# EasyEDA Pro project eda_uahyxtbgs-165w-three-way-multi-protocol-fa-dc91a91e.epro, schematic 165W指示灯版三路桌面电源
Board Name: 165W 三路多协议快充电源; Create Date: 2025-04-07; Page Name: P1; Project Name: （高颜值）220V供电165W三路多协议桌面快充电源; Schematic Name: 165W 三路多协议快充电源; Update Date: 2025-04-09; Company: 嘉立创EDA; Page Size: A4; Version: V1.0
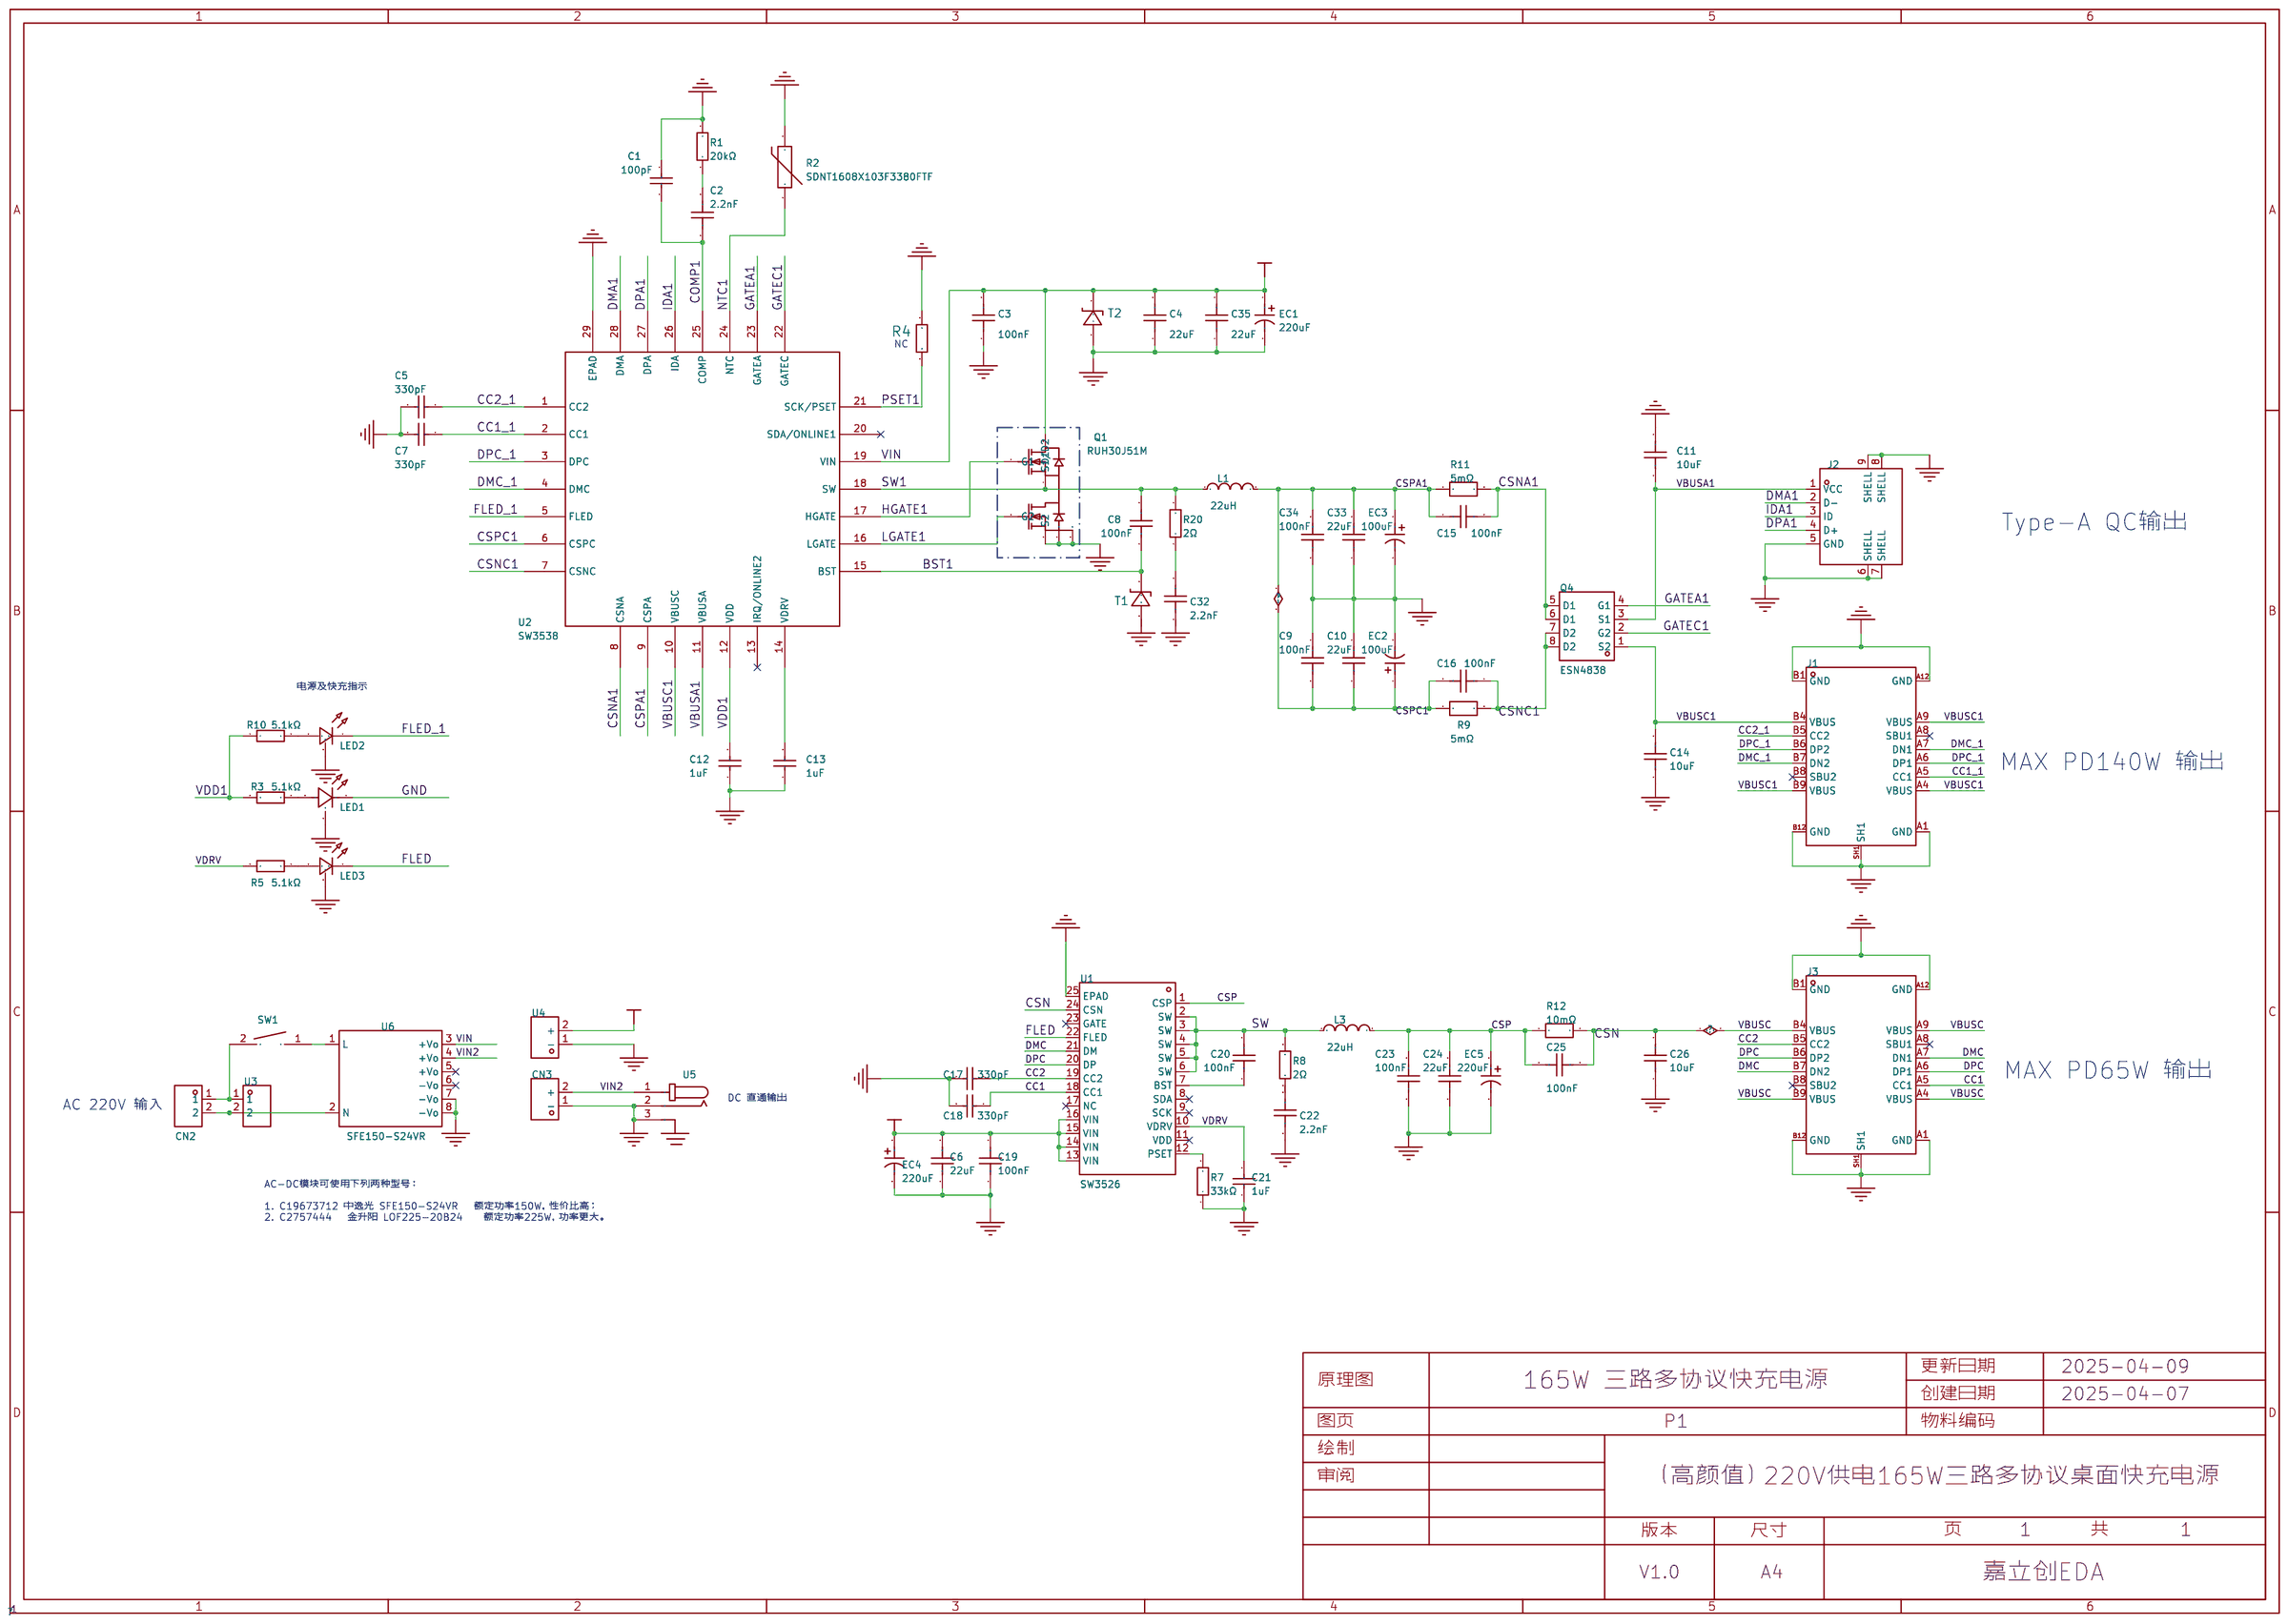
[diagram p0: schematic sheet]

## Parts
C1  100pF  [C0603]
C2  2.2nF  [C0603_1]
C3  100nF  [C0603_1]
C4  22uF  [C0805]
C5  330pF  [C0603]
C6  22uF  [C0805]
C7  330pF  [C0603]
C8  100nF  [C0603_1]
C9  100nF  [C0603_1]
C10  22uF  [C0805]
C11  10uF  [C0805]
C12  1uF  [C0603]
C13  1uF  [C0603]
C14  10uF  [C0805]
C15  100nF  [C0603_1]
C16  100nF  [C0603_1]
C17  330pF  [C0603]
C18  330pF  [C0603]
C19  100nF  [C0603_1]
C20  100nF  [C0603_1]
C21  1uF  [C0603]
C22  2.2nF  [C0603_1]
C23  100nF  [C0603_1]
C24  22uF  [C0805]
C25  100nF  [C0603_1]
C26  10uF  [C0805]
C32  2.2nF  [C0603_1]
C33  22uF  [C0805]
C34  100nF  [C0603_1]
C35  22uF  [C0805]
CN2  RT-C08-F2-BH  [AC-IN-TH_RT-C08-F2-WH]
CN3  XT30UPB-M  [CONN-TH_XT30UPB-M]
EC1  220uF  [CAP-TH_BD8.0-P3.50-D0.6-FD-2]
EC2  100uF  [CAP-TH_BD8.0-P3.50-D0.6-FD]
EC3  100uF  [CAP-TH_BD8.0-P3.50-D0.6-FD]
EC4  220uF  [CAP-TH_BD8.0-P3.50-D0.6-FD-2]
EC5  220uF  [CAP-TH_BD8.0-P3.50-D0.6-FD-2]
J1  U263-163N-4OS1735  [USB-C-SMD_U263-163N-4GS1735]
J2  U224-051N-3GRA035  [USB-A-TH_U224-051N-3GRA035]
J3  U263-163N-4OS1735  [USB-C-SMD_U263-163N-4GS1735]
L1  22uH  [IND-TH_L20-W10-P9.00-D1.2]
L3  22uH  [IND-TH_L20-W10-P9.00-D1.2]
LED1  XL-3210UGC  [LED-SMD_3P-L3.2-W1.5-RD_GREEN]
LED2  XL-3210UOC  [LED-SMD_3P-L3.2-W1.5-RD_ORANGE]
LED3  XL-3210UOC  [LED-SMD_3P-L3.2-W1.5-RD_ORANGE]
Q1  RUH30J51M  [DFN-8_L6.0-W5.0-P1.27_AON6938]
Q4  ESN4838  [DFN-8_L3.0-W3.0-P0.65-LS3.4-BL]
R1  20kΩ  [R0603]
R2  SDNT1608X103F3380FTF  [R0603_1]
R3  5.1kΩ  [R0603_1]
R4  100kΩ  [R0603_1]
R5  5.1kΩ  [R0603_1]
R7  33kΩ  [R0603]
R8  2Ω  [R0603_1]
R9  5mΩ  [R1206]
R10  5.1kΩ  [R0603_1]
R11  5mΩ  [R1206]
R12  10mΩ  [R1206]
R20  2Ω  [R0603_1]
SW1  RS601HL-1010011BB  [SW-TH_RS601HL-1010011BB]
T1  SMF30A  [SOD-123_L2.6-W1.6-LS3.5-RD]
T2  SMF30A  [SOD-123_L2.6-W1.6-LS3.5-RD]
U1  SW3526  [QFN-24_L4.0-W4.0-P0.50-TL-EP2.5]
U2  SW3538  [QFN-28_L4.0-W4.0-P0.40-TL-EP2.4]
U3  DBT50G-7.62-2P-BK-P  [CONN-TH_2P-P7.62_L15.2-W16.7-EX4.2]
U4  XT30UPB-M  [CONN-TH_XT30UPB-M]
U5  HX DC007B-2.0-J  [DC-IN-TH_HX-DC007B-2.5]
U6  SFE150-S24VR  [LOF225-20B24]

## Library data of the parts
C1 = CL10C101JB8NNNC: 容值:100pF;精度:±5%;额定电压:50V;材质(温度系数):C0G;; LCSC Part Name: 100pF ±5% 50V; Supplier Part: C14858; Manufacturer: SAMSUNG(三星); Supplier Footprint: 0603; JLCPCB Part Class: 基础库; Datasheet: https://atta.szlcsc.com/upload/public/pdf/source/20160103/1457707672333.pdf; Supplier: LCSC; Tolerance: ±5%; Voltage Rated: 50V; Temperature Coefficient: C0G
C2 = FCC0603B222K500CT: 容值:2.2nF;精度:±10%;额定电压:50V;温度系数:X7R;; LCSC Part Name: 2.2nF ±10% 50V; Supplier Part: C5137562; Manufacturer: FOJAN(富捷); Supplier Footprint: 0603; JLCPCB Part Class: Extended Part; Datasheet: https://atta.szlcsc.com/upload/public/pdf/source/20220818/0EB3B7FB2F5648AC16609637FBA7DABE.pdf; Supplier: LCSC; Tolerance: ±10%; Voltage Rated: 50V; Temperature Coefficient: X7R; Voltage Rating: 50V
C3 C8 C9 C15 C16 C19 C20 C23 C25 C34 = GRM188R71H104KA93D: 容值:100nF;精度:±10%;额定电压:50V;材质(温度系数):X7R;; LCSC Part Name: 100nF ±10% 50V; Supplier Part: C77055; Manufacturer: muRata(村田); Supplier Footprint: 0603; JLCPCB Part Class: Extended Part; Datasheet: https://atta.szlcsc.com/upload/public/pdf/source/20200305/C490387_23319AE8C154DEB24C505E6C82A8106A.pdf; Supplier: LCSC; Tolerance: ±10%; Voltage Rated: 50V; Temperature Coefficient: X7R
C4 C6 C10 C24 C33 C35 = CGA0805X5R226M350MT: 容值:22uF;精度:±20%;额定电压:35V;材质(温度系数):X5R;; LCSC Part Name: 22uF ±20% 35V; Supplier Part: C6119901; Manufacturer: HRE(芯声); Supplier Footprint: 0805; JLCPCB Part Class: Extended Part; Datasheet: https://atta.szlcsc.com/upload/public/pdf/source/20231129/D589D0CC4D260F7AC3A77E53B455CCB3.pdf; Supplier: LCSC; Tolerance: ±20%; Voltage Rated: 35V; Temperature Coefficient: X5R
C5 C7 C17 C18 = CL10C331JB8NNNC: 容值:330pF;精度:±5%;额定电压:50V;材质(温度系数):C0G;; LCSC Part Name: 330pF ±5% 50V; Supplier Part: C1664; Manufacturer: SAMSUNG(三星); Supplier Footprint: 0603; JLCPCB Part Class: 基础库; Datasheet: https://atta.szlcsc.com/upload/public/pdf/source/20160103/1457707688612.pdf; Supplier: LCSC; Tolerance: ±5%; Voltage Rated: 50V; Temperature Coefficient: C0G
C11 C14 C26 = CGA0805X5R106K350MT: 容值:10uF;精度:±10%;额定电压:35V;材质(温度系数):X5R;; LCSC Part Name: 10uF ±10% 35V; Supplier Part: C6119888; Manufacturer: HRE(芯声); Supplier Footprint: 0805; JLCPCB Part Class: Extended Part; Supplier: LCSC; Tolerance: ±10%; Voltage Rated: 35V; Temperature Coefficient: X5R
C12 C13 C21 = CL10A105KB8NNNC: 容值:1uF;精度:±10%;额定电压:50V;材质(温度系数):X5R;; LCSC Part Name: 1uF ±10% 50V; Supplier Part: C15849; Manufacturer: SAMSUNG(三星); Supplier Footprint: 0603; JLCPCB Part Class: 基础库; Datasheet: https://atta.szlcsc.com/upload/public/pdf/source/20160103/1457707679084.pdf; Supplier: LCSC; Tolerance: ±10%; Voltage Rated: 50V; Temperature Coefficient: X5R
C22 C32 = FCC0603B222K500CT: 容值:2.2nF;精度:±10%;额定电压:50V;材质(温度系数):X7R;; LCSC Part Name: 2.2nF ±10% 50V; Supplier Part: C5137562; Manufacturer: FOJAN(富捷); Supplier Footprint: 0603; JLCPCB Part Class: Extended Part; Datasheet: https://atta.szlcsc.com/upload/public/pdf/source/20220818/0EB3B7FB2F5648AC16609637FBA7DABE.pdf; Supplier: LCSC; Tolerance: ±10%; Voltage Rated: 50V; Temperature Coefficient: X7R
CN2 = RT-C08-F2-BH: LCSC Part Name: AC插座; Supplier Part: C22379837; Manufacturer: Legion(六钧); Supplier Footprint: 插件; JLCPCB Part Class: Extended Part; Datasheet: https://atta.szlcsc.com/upload/public/pdf/source/20240410/1D0DCE57595CC1DDC95DE3B3655204B3.pdf; Supplier: LCSC; Standard: IEC 320-C8; Number of Ports: 1; PIN Number Per Port: 2; Mounting Style: 弯插; Current Rating (Max): 7A; Rated Voltage (Max): 125V
CN3 U4 = XT30UPB-M: 类别:-;类型1:-;; LCSC Part Name: AMASS(艾迈斯)板载立式 航模锂电池控制器连接器插头 公头XT30UPB-M; Supplier Part: C428721; Manufacturer: AMASS(艾迈斯); JLCPCB Part Class: Extended Part; Datasheet: https://atta.szlcsc.com/upload/public/pdf/source/20230412/7B5DFEF57C9EA5273853390C734B3AC5.pdf; Supplier: LCSC; Brand: 艾迈斯; Type: 航模插头; Colour: 黄色; RatedVoltage: DC 500V; InterfaceType: 公头; MetalMaterial: 镀金; InsulationMaterial: PA; RatedCurrent: 15A; contact resistance: 0.65mΩ
EC1 EC4 EC5 = KNH2220UF35V149EC0049: 容值:220uF;精度:±20%;额定电压:35V;纹波电流:1.7A@100kHz;等效串联电阻:40mΩ@100kHz;; LCSC Part Name: 220uF ±20% 35V; Supplier Part: C2981462; Manufacturer: KNSCHA(科尼盛); Supplier Footprint: 插件,D8xL9mm; JLCPCB Part Class: Extended Part; Datasheet: https://atta.szlcsc.com/upload/public/pdf/source/20220426/9FC8A158D93B909CC105160B4A0CB698.pdf; Supplier: LCSC; Tolerance: ±20%; Rated Voltage: 35V; φD: 8mm; L: 9mm; Lead Spacing: 3.5mm; Ripple Current: 1.7A@100kHz; Equivalent Series Resistance(ESR): 40mΩ@100kHz; Lifetime @ Temp: 2000hrs@105℃; Operating Temperature: -55℃~+105℃
EC2 EC3 = 1010500812R00: 容值:100uF;精度:±20%;额定电压:50V;; LCSC Part Name: 100uF ±20% 50V; Supplier Part: C2887231; Manufacturer: NJCON(永立); Supplier Footprint: 插件,D8xL12mm; JLCPCB Part Class: Extended Part; Datasheet: https://atta.szlcsc.com/upload/public/pdf/source/20210902/84CE7E45D44660992A8A41ADB32108B0.pdf; Supplier: LCSC; Tolerance: ±20%; Rated Voltage: 50V; φD: 8mm; L: 12mm; Operating Temperature: -55℃~+105℃
J1 J3 = U263-163N-4OS1735: 连接器类型:Type-C;标准:-;公母:母;安装方式:-;触点数量:16P;端口数量:1;额定电流 - 电源:5A;触头材质:铜合金;触头镀层:金;工作温度范围:-25℃~+85℃;焊接温度(最大值):260℃;; LCSC Part Name: Type-C 母; Supplier Part: C2931472; Manufacturer: XKB Connection(中国星坤); Supplier Footprint: SMD; JLCPCB Part Class: Extended Part; Datasheet: https://atta.szlcsc.com/upload/public/pdf/source/20211215/D777AAC9FA67A227A25094451B68E75F.pdf; Supplier: LCSC; Connector Type: Type-C; Gender: 母; Number of Contacts: 16P; Number of Ports: 1; Current Rating - Power (Max): 5A; Contact Material: 铜合金; Contact Plating: 金; Operating Temperature Range: -25℃~+85℃; Welding Temperature (Max): 260℃; Soldering Temperature(Max): 260℃
J2 = U224-051N-3GRA035: 连接器类型:Type-A;标准:-;公母:母;安装方式:-;触点数量:4P;端口数量:1;额定电流 - 电源:5A;触头材质:铜合金;触头镀层:金;工作温度范围:-25℃~+85℃;焊接温度(最大值):235℃;; LCSC Part Name: Type-A 母; Supplier Part: C2689740; Manufacturer: XKB Connection(中国星坤); Supplier Footprint: 插件; JLCPCB Part Class: Extended Part; Datasheet: https://atta.szlcsc.com/upload/public/pdf/source/20211011/F7C7F98144CE000F17F3BF56356B0B89.pdf; Supplier: LCSC; Connector Type: Type-A; Gender: 母; Number of Contacts: 4P; Number of Ports: 1; Current Rating - Power (Max): 5A; Contact Material: 铜合金; Contact Plating: 金; Operating Temperature Range: -25℃~+85℃; Soldering Temperature(Max): 235℃
L1 L3 = XR6826T220MV1L: 电感值:22uH;精度:±10%;额定电流:7.8A;饱和电流(Isat):10A;类型:磁环电感;; LCSC Part Name: 22uH ±10% 10A 磁环电感; Supplier Part: C22447589; Manufacturer: XR(祥如); Supplier Footprint: 插件,D=22.5mm; JLCPCB Part Class: Extended Part; Datasheet: https://atta.szlcsc.com/upload/public/pdf/source/20240529/9CB74FDAFA0CB689F22D39E169D0FCBE.pdf; Supplier: LCSC; Tolerance: ±10%; Rated Current: 7.8A; Current - Saturation (Isat): 10A; Type: 磁环电感; Wire Diameter: 1mm; Check: false
LED1 = XL-3210UGC: 发光颜色:翠绿色;功率:80mW;正向电流:25mA;主波长:517.5nm~525nm;透镜颜色:无色透明透镜;色温:-;发光角度:120°;载带方式:侧贴;工作温度:-30℃~+85℃;; Supplier Part: C965877; Manufacturer: XINGLIGHT(成兴光); Supplier Footprint: SMD,1.5x3.2mm; JLCPCB Part Class: Extended Part; Datasheet: https://atta.szlcsc.com/upload/public/pdf/source/20240218/E77B72BDB59DD1B3FB2CB7C571283648.pdf; Supplier: LCSC; Emitted Color: 翠绿色; Power Dissipation: 80mW; Forward Current: 25mA; Dominant Wavelength: 517.5nm~525nm; Peak Wavelength: 535nm; Lens Color: 无色透明透镜; Viewing Angle: 120°; Mounting Sytle: 侧贴; Operating Temperature: -30℃~+85℃
LED2 LED3 = XL-3210UOC: 发光颜色:橙色;功率:55mW;正向电流:25mA;主波长:600nm~604nm;透镜颜色:无色透明透镜;色温:-;发光角度:120°;载带方式:侧贴;工作温度:-30℃~+85℃;; Supplier Part: C965875; Manufacturer: XINGLIGHT(成兴光); Supplier Footprint: SMD,1.5x3.2mm; JLCPCB Part Class: Extended Part; Datasheet: https://atta.szlcsc.com/upload/public/pdf/source/20221102/65FA4F7E3FDD2B5F4520C1C99DAF0F19.pdf; Supplier: LCSC; Emitted Color: 橙色; Power Dissipation: 55mW; Forward Current: 25mA; Dominant Wavelength: 600nm~604nm; Peak Wavelength: 608nm; Lens Color: 无色透明透镜; Viewing Angle: 120°; Mounting Sytle: 侧贴; Operating Temperature: -30℃~+85℃
Q1 = RUH30J51M: Supplier Part: C3019595; Manufacturer: Ruichips(锐骏半导体); Supplier Footprint: DFN-8(5x6); JLCPCB Part Class: Extended Part; Datasheet: https://atta.szlcsc.com/upload/public/pdf/source/20220614/0174D7ED654B176846E53ECDED748663.pdf; Supplier: LCSC
Q4 = ESN4838: 类型:2个N沟道;漏源电压(Vdss):30V;连续漏极电流(Id):33A;导通电阻(RDS(on)@Vgs,Id):7.5mΩ@10V,20A;功率(Pd):21W;阈值电压(Vgs(th)@Id):1.4V@250uA;; LCSC Part Name: 2个N沟道 耐压:30V 电流:33A; Supplier Part: C5350984; Manufacturer: ElecSuper(静芯微); Supplier Footprint: PDFN3x3; JLCPCB Part Class: 扩展库; Datasheet: https://atta.szlcsc.com/upload/public/pdf/source/20240905/2590CC42905E1517235B6C02C2A5849A.pdf; Supplier: LCSC; Type: 2个N沟道; Drain Source Voltage (Vdss): 30V; Continuous Drain Current (Id): 33A; Drain Source On Resistance (RDS(on)@Vgs,Id): 7.5mΩ@10V,20A; Power Dissipation (Pd): 21W; Gate Threshold Voltage (Vgs(th)@Id): 1.4V@250uA; Total Gate Charge (Qg@Vgs): 18nC@10V; Input Capacitance (Ciss@Vds): 1.08nF@15V; Reverse Transfer Capacitance (Crss@Vds): 110pF@15V; Operating Temperature: -55℃~+150℃@(Tj)
R1 = 0603WAF2002T5E: 电阻类型:厚膜电阻;阻值:20kΩ;精度:±1%;功率:100mW;最大工作电压:75V;温度系数:±100ppm/℃;; LCSC Part Name: 20KΩ ±1%; Supplier Part: C4184; Manufacturer: UNI-ROYAL(厚声); Supplier Footprint: 0603; JLCPCB Part Class: 基础库; Datasheet: https://atta.szlcsc.com/upload/public/pdf/source/20170920/C4184_1505887495503980652.pdf; Supplier: LCSC; Tolerance: ±1%; Temperature Coefficient: ±100ppm/℃; Power(Watts): 1/10W; Overload Voltage (Max): 75V; Operating Temperature Range: -55℃~+155℃; Type: 厚膜电阻
R2 = SDNT1608X103F3380FTF: 阻值(25℃):10kΩ;B值(25℃/50℃):3380K;电阻精度:±1%;功率:100mW;B值精度:±1%;最大稳态电流(25℃):310uA;; LCSC Part Name: 10kΩ 电阻精度:±1% 3380K; Supplier Part: C316397; Manufacturer: Sunlord(顺络); Supplier Footprint: 0603; JLCPCB Part Class: Extended Part; Datasheet: https://atta.szlcsc.com/upload/public/pdf/source/20210916/BF106A3565EDFEB141CB3E0EA3A661F8.pdf; Supplier: LCSC; Resistance @ 25℃: 10kΩ; B Constant (25℃/50℃): 3380K; Resistance Tolerance: ±1%; Power: 100mW; B Constant Tolerance: ±1%; Steady State Current (Max): 310uA; Operating Temperature: -55℃~+125℃
R3 R5 R10 = 0603WAF5101T5E: 电阻类型:厚膜电阻;阻值:5.1kΩ;精度:±1%;功率:100mW;最大工作电压:75V;温度系数:±100ppm/℃;; LCSC Part Name: 5.1kΩ ±1% 100mW 厚膜电阻; Supplier Part: C23186; Manufacturer: UNI-ROYAL(厚声); Supplier Footprint: 0603; JLCPCB Part Class: Basic Part; Datasheet: https://atta.szlcsc.com/upload/public/pdf/source/20200306/C422600_1E6D84923E4A46A82E41ADD87F860B5C.pdf; Supplier: LCSC; Type: 厚膜电阻; Tolerance: ±1%; Power(Watts): 100mW; Overload Voltage (Max): 75V; Temperature Coefficient: ±100ppm/℃; Operating Temperature Range: -55℃~+155℃
R4 = 0603WAF1003T5E: 电阻类型:厚膜电阻;阻值:100kΩ;精度:±1%;功率:100mW;最大工作电压:75V;温度系数:±100ppm/℃;; LCSC Part Name: 100kΩ ±1% 100mW 厚膜电阻; Supplier Part: C25803; Manufacturer: UNI-ROYAL(厚声); Supplier Footprint: 0603; JLCPCB Part Class: Basic Part; Datasheet: https://atta.szlcsc.com/upload/public/pdf/source/20200306/C422600_1E6D84923E4A46A82E41ADD87F860B5C.pdf; Supplier: LCSC; Type: 厚膜电阻; Tolerance: ±1%; Power(Watts): 100mW; Overload Voltage (Max): 75V; Temperature Coefficient: ±100ppm/℃; Operating Temperature Range: -55℃~+155℃
R7 = 0603WAF3302T5E: 阻值:33kΩ;精度:±1%;温度系数:±100ppm/℃;功率:1/10W;最大工作电压:75V;工作温度范围:-55℃~+155℃;; LCSC Part Name: 33KΩ ±1%; Supplier Part: C4216; Manufacturer: UNI-ROYAL(厚声); Supplier Footprint: 0603; JLCPCB Part Class: 基础库; Datasheet: https://atta.szlcsc.com/upload/public/pdf/source/20170920/C4216_1505887497914980657.pdf; Supplier: LCSC; Tolerance: ±1%; Temperature Coefficient: ±100ppm/℃; Power(Watts): 1/10W; Overload Voltage (Max): 75V; Operating Temperature Range: -55℃~+155℃
R8 = 0603WAF200KT5E: 电阻类型:厚膜电阻;阻值:2Ω;精度:±1%;功率:100mW;最大工作电压:75V;温度系数:±200ppm/℃;; LCSC Part Name: 2Ω ±1% 100mW 厚膜电阻; Supplier Part: C22977; Manufacturer: UNI-ROYAL(厚声); Supplier Footprint: 0603; JLCPCB Part Class: Basic Part; Datasheet: https://atta.szlcsc.com/upload/public/pdf/source/20200306/C422600_1E6D84923E4A46A82E41ADD87F860B5C.pdf; Supplier: LCSC; Type: 厚膜电阻; Tolerance: ±1%; Power(Watts): 100mW; Overload Voltage (Max): 75V; Temperature Coefficient: ±200ppm/℃; Operating Temperature Range: -55℃~+155℃
R9 R11 = HoLLR1206-1W-5mR-1%: 电阻类型:采样电阻;阻值:5mΩ;精度:±1%;额定压降:-;功率:1W;温度系数:±50ppm/℃;安装方式:贴片;; LCSC Part Name: 5mΩ ±1% 1W; Supplier Part: C2988648; Manufacturer: Milliohm(毫欧); Supplier Footprint: 1206; JLCPCB Part Class: Extended Part; Datasheet: https://atta.szlcsc.com/upload/public/pdf/source/20220407/F189C92CC2C10DCB4BF36375122B9E11.pdf; Supplier: LCSC; Type: 采样电阻; Tolerance: ±1%; Power(Watts): 1W; Rated Current: 31.6A; Temperature Coefficient: ±50ppm/℃; Mounting Sytle: 贴片
R12 = FRM121WFR010TM: 电阻类型:采样电阻;阻值:10mΩ;精度:±1%;额定压降:-;功率:1W;温度系数:±50ppm/℃;安装方式:-;; LCSC Part Name: 10mΩ ±1% 1W; Supplier Part: C7467248; Manufacturer: FOJAN(富捷); Supplier Footprint: 1206; JLCPCB Part Class: Extended Part; Datasheet: https://atta.szlcsc.com/upload/public/pdf/source/20240709/7FCE84187288C94C67B1004F90EDDF14.pdf; Supplier: LCSC; Type: 采样电阻; Tolerance: ±1%; Power(Watts): 1W; Temperature Coefficient: ±50ppm/℃
R20 = 0603WAF200KT5E: 电阻类型:厚膜电阻;阻值:2Ω;精度:±1%;功率:100mW;最大工作电压:75V;温度系数:±200ppm/℃;; LCSC Part Name: 2Ω ±1% 100mW 厚膜电阻; Supplier Part: C22977; Manufacturer: UNI-ROYAL(厚声); Supplier Footprint: 0603; JLCPCB Part Class: 基础库; Datasheet: https://atta.szlcsc.com/upload/public/pdf/source/20200306/C422600_1E6D84923E4A46A82E41ADD87F860B5C.pdf; Supplier: LCSC; Type: 厚膜电阻; Tolerance: ±1%; Power(Watts): 100mW; Overload Voltage (Max): 75V; Temperature Coefficient: ±200ppm/℃; Operating Temperature Range: -55℃~+155℃
SW1 = RS601HL-1010011BB: 带灯:无;引脚样式:焊片;额定电流:3A;额定电压(AC):250V;额定电压(DC):-;电路结构:单刀单掷;机械寿命:1万次;; Supplier Part: C2885782; Manufacturer: HCTL(华灿天禄); Supplier Footprint: 插件; JLCPCB Part Class: Extended Part; Datasheet: https://atta.szlcsc.com/upload/public/pdf/source/20210820/B1970E40D09304D7FA648AE2099FB3E8.pdf; Supplier: LCSC; Switch Length: 15mm; Switch Width: 10.5mm; Switch Height: 11.7mm; Actuator Type: 凹面弯曲; With Lamp: 无; Pin Style: 焊片; Actuator Color: 黑色; Contact Current: 3A; Voltage Rating (AC): 250V; Circuit: 单刀单掷; Mechanical Life: 1万次; Operating Temperature: -25℃~+85℃; Actuator Identifier: - O
T1 T2 = SMF30A_C364281: 反向截止电压(Vrwm):30V;最大钳位电压:48.4V;峰值脉冲电流(Ipp)@10/1000us:4.1A;击穿电压:33.3V;; LCSC Part Name: 单向TVS 30V截止 4.1A峰值脉冲; Supplier Part: C364281; Manufacturer: MDD; Supplier Footprint: SOD-123FL; JLCPCB Part Class: Extended Part; Datasheet: https://atta.szlcsc.com/upload/public/pdf/source/20230823/46DC63B2A09D9D06F4FC5ACC8B9FF97C.pdf; Supplier: LCSC; Reverse Stand-Off Voltage (Vrwm): 30V; Maximum Clamping Voltage: 48.4V; Peak Pulse Current (Ipp)@10/1000us: 4.1A; Breakdown Voltage: 33.3V; Type: TVS
U1 = SW3526: Supplier Part: C2912236; Supplier Footprint: QFN-24-EP(4x4); JLCPCB Part Class: 扩展库; Supplier: LCSC
U2 = SW3538: Supplier Part: C9900059493; Supplier Footprint: QFN28 4X4; Supplier: LCSC
U3 = DBT50G-7.62-2P-BK-P: 隔板类型:带盖板;间距:7.62mm;结构:1x2P;安装方式:直针;引脚位置:边脚;排数:1;额定电流:20A;额定电压:300V;线规 - AWG:12~22;线规 - 平方毫米:-;工作温度范围:-40℃~+105℃;颜色:黑色;每排PIN数:2;; LCSC Part Name: 7.62mm 1x2P 每排P数:2 排数:1 直针 边脚; Supplier Part: C496127; Manufacturer: DORABO(地博电气); Supplier Footprint: 插件,P=7.62mm; JLCPCB Part Class: Extended Part; Datasheet: https://atta.szlcsc.com/upload/public/pdf/source/20230321/5EF6A0D07A73B1490602C5D26A4C0507.pdf; Supplier: LCSC; Barrier Type: 带盖板; Pitch: 7.62mm; Structure: 1x2P; Mounting Style: 直针; Pin Location: 边脚; Number of Pins: 2P; Number of Rows: 1; Current Rating (Max): 20A; Voltage Rating (Max): 300V; Wire Gauge - AWG: 12~22; Operating Temperature Range: -40℃~+105℃; Color: 黑色; Number of PINs Per Row: 2
U5 = HX DC007B-2.0-J: 连接器类型:DC电源插座;安装方式:弯插;触点内径:2mm;触点外径:6mm;额定电流:7A;额定电压:20V;触头镀层:金;工作温度范围:-25℃~+70℃;; LCSC Part Name: DC电源插座 内径:2mm 外径:6mm; Supplier Part: C19189082; Manufacturer: hanxia(韩下); Supplier Footprint: 插件; JLCPCB Part Class: 扩展库; Datasheet: https://atta.szlcsc.com/upload/public/pdf/source/20231103/2AF7900BFBDFCD45579201C2C7932A72.pdf; Supplier: LCSC; Connector Type: DC电源插座; Mounting Style: 弯插; Inside Contact Diameter: 2mm; Outside Contact Diameter: 6mm; Current Rating (Max): 7A; Voltage Rating (Max): 20V; Contact Plating: 金; Operating Temperature Range: -25℃~+70℃
U6 = LOF225-23B27R2: Manufacturer: 中逸光; Supplier: LCSC; Supplier Part: C19673712; LCSC Part Name: 225W AC-DC开板电源; Supplier Footprint: 插件; JLCPCB Part Class: 扩展库; Check: false

## Nets
GND: C1.2 C3.1 C4.1 C5.2 C6.1 C7.2 C9.1 C10.1 C11.1 C12.1 C13.1 C14.1 C17.2 C18.2 C19.1 C21.1 C22.1 C23.1 C24.1 C26.1 C32.1 C33.1 C34.1 C35.1 CN3.1(-) EC1.2 EC2.2 EC3.2 EC4.2 EC5.2 J1.A1(GND) J1.A12(GND) J1.B1(GND) J1.B12(GND) J1.SH1 J2.5(GND) J2.6(SHELL) J2.7(SHELL) J2.8(SHELL) J2.9(SHELL) J3.A1(GND) J3.A12(GND) J3.B1(GND) J3.B12(GND) J3.SH1 LED1.1 LED1.3 LED2.3(1) LED3.3(1) Q1.3(S2) Q1.4(S2) Q1.5(S2) R1.1 R2.1 R4.1 R7.1 T1.2(A) T2.2(A) U1.25(EPAD) U2.29(EPAD) U4.1(-) U5.2 U5.3 U6.7(-Vo) U6.8(-Vo)
VBUSA1: C11.2 J2.1(VCC) Q4.3(S1) U2.11(VBUSA)
VBUSC1: C14.2 J1.A4(VBUS) J1.A9(VBUS) J1.B4(VBUS) J1.B9(VBUS) Q4.1(S2) U2.10(VBUSC)
VDD1: C12.2 R3.2 R10.1 U2.12(VDD)
VIN: C3.2 C4.2 C35.2 EC1.1 Q1.2(D1) T2.1(K) U2.19(VIN) U4.2(+) U6.3(+Vo)
VIN2: C6.2 C19.2 CN3.2(+) EC4.1 U1.13(VIN) U1.14(VIN) U1.15(VIN) U1.16(VIN) U5.1 U6.4(+Vo)
BST1: C8.1 T1.1(K) U2.15(BST)
CC1: C18.1 J3.A5(CC1) U1.18(CC1)
CC1_1: C7.1 J1.A5(CC1) U2.2(CC1)
CC2: C17.1 J3.B5(CC2) U1.19(CC2)
CC2_1: C5.1 J1.B5(CC2) U2.1(CC2)
COMP1: C1.1 C2.1 U2.25(COMP)
CSN: C25.2 C26.2 J3.A4(VBUS) J3.A9(VBUS) J3.B4(VBUS) J3.B9(VBUS) R12.2 U1.24(CSN)
CSNA1: C15.2 Q4.5(D1) Q4.6(D1) R11.2 U2.8(CSNA)
CSNC1: C16.1 Q4.7(D2) Q4.8(D2) R9.2 U2.7(CSNC)
CSP: C23.2 C24.2 C25.1 EC5.1 L3.2 R12.1 U1.1(CSP)
CSPA1: C9.2 C10.2 C15.1 C16.2 C33.2 C34.2 EC2.1 EC3.1 L1.2 R9.1 R11.1 U2.6(CSPC) U2.9(CSPA)
DMA1: J2.2(D-) U2.28(DMA)
DMC: J3.A7(DN1) J3.B7(DN2) U1.21(DM)
DMC_1: J1.A7(DN1) J1.B7(DN2) U2.4(DMC)
DPA1: J2.4(D+) U2.27(DPA)
DPC: J3.A6(DP1) J3.B6(DP2) U1.20(DP)
DPC_1: J1.A6(DP1) J1.B6(DP2) U2.3(DPC)
FLED: LED3.1(C) U1.22(FLED)
FLED_1: LED2.1(C) U2.5(FLED)
GATEA1: Q4.4(G1) U2.23(GATEA)
GATEC1: Q4.2(G2) U2.22(GATEC)
HGATE1: Q1.1(G1) U2.17(HGATE)
IDA1: J2.3(ID) U2.26(IDA)
LGATE1: Q1.6(G2) U2.16(LGATE)
NTC1: R2.2 U2.24(NTC)
PSET1: R4.2 U2.21(SCK/PSET)
SW: C20.2 L3.1 R8.2 U1.2(SW) U1.3(SW) U1.4(SW) U1.5(SW) U1.6(SW)
SW1: C8.2 L1.1 Q1.7(S1/D2) R20.2 U2.18(SW)
VDRV: C21.2 R5.2 U1.10(VDRV)
$C2_2: C2.2 R1.2
$C13_2: C13.2 U2.14(VDRV)
$C20_1: C20.1 U1.7(BST)
$C22_2: C22.2 R8.1
$C32_2: C32.2 R20.1
$LED1_2: LED1.2 R3.1
$LED2_2: LED2.2(A) R10.2
$LED3_2: LED3.2(A) R5.1
$R7_2: R7.2 U1.12(PSET)
Net-(CN2-1): CN2.1 SW1.2 U3.1
Net-(CN2-2): CN2.2 U3.2 U6.2(N)
Net-(SW1-1): SW1.1 U6.1(L)

Not connected (* = marked no-connect by the designer): J1 A8(SBU1)* B8(SBU2)*; J3 A8(SBU1)* B8(SBU2)*; U1 8(SDA)* 9(SCK)* 11(VDD)* 17(NC)* 23(GATE)*; U2 13(IRQ/ONLINE2)* 20(SDA/ONLINE1)*; U6 5(+Vo)* 6(-Vo)*

## Notes on the sheet
- NC
- Type-A QC输出
- 电源及快充指示
- MAX PD140W 输出
- MAX PD65W 输出
- DC 直通输出
- AC 220V 输入
- AC-DC模块可使用下列两种型号：
  1. C19673712 中逸光 SFE150-S24VR   额定功率150W，性价比高；
  2. C2757444   金升阳 LOF225-20B24    额定功率225W，功率更大。
